# Altium project 12_PCB_Project_12.PrjPcb
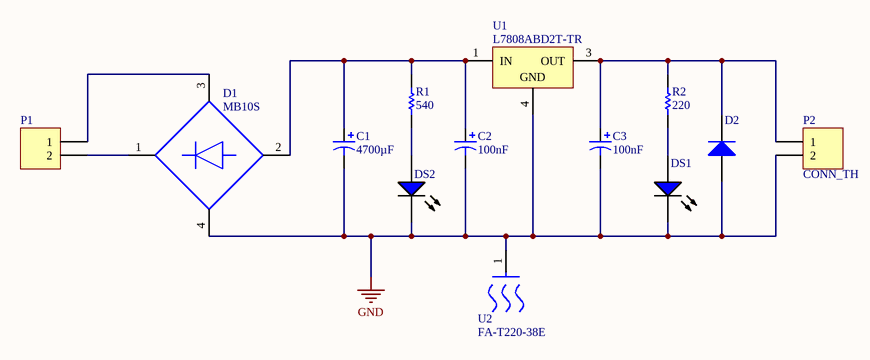
[diagram p0: Sheet1.SchDoc]
1 sheet, 13 parts. Net scope: global (net labels, ports and power ports of the same name join across sheets).
Board file: PCB2.PcbDoc

## Sheet Sheet1.SchDoc
size A; SheetNumber: 1; SheetTotal: 1; SPICEModelCachePIGDLGUO: <root> / <DocumentId>PIGDLGUO</DocumentId> / <CacheFrame Number="0"> / <Model Name="1n4007" Kind="MDL"> / <Text>*1N4007 MCE 8-16-95 / *1000V 1A Si GenPurpose Diode pkg:DIODE0.4 1,2 / .MODEL 1N4007 D(IS=2.55E-9 RS=0.042 N=1.75 TT=5.76E-6 CJO=1.85E-11 / + VJ=0.75 M=0.333 BV=1000 IBV=9.86E-5 )</Text> / </Model> / </CacheFrame> / </root>

### Parts
C1  value 4700µF  [RB7.6-15]  (hidden comment: Cap Pol1)
C2  value 100nF  [RB7.6-15]  (hidden comment: Cap Pol1)
C3  value 100nF  [RB7.6-15]  (hidden comment: Cap Pol1)
D1  MB10S  [FP-751EP-MFG]
D2  1N4007  [DO-41]  (value not drawn)
DS1  WP710A10QBC/D  [KING-WP710A10QBCD_V]  (value not drawn)
DS2  WP710A10QBC/D  [KING-WP710A10QBCD_V]  (value not drawn)
P1  Header 2  [HDR1X2]  (value not drawn)
P2  CONN_TH  [HDR1X2]
R1  value 540  [AXIAL-0.3]  (hidden comment: Res1)
R2  value 220  [AXIAL-0.3]  (hidden comment: Res1)
U1  L7808ABD2T-TR  [TO-263_L]
U2  FA-T220-38E  [FP-FA-T220-38E-MFG]

### Nets
GND: C1.2 C2.2 C3.2 D1.4(2_~) D2.1(A) DS1.2(K) DS2.2(K) P2.2 U1.4(GND) U2.1(MNT_1)
NetC1_1: C1.1 C2.1 D1.2(-) R1.2 U1.1(IN)
NetC3_1: C3.1 D2.2(K) P2.1 R2.2 U1.3(OUT)
NetD1_1: D1.1(+) P1.2
NetD1_3: D1.3(1_~) P1.1
NetDS1_1: DS1.1(A) R2.1
NetDS2_1: DS2.1(A) R1.1

### Library data of the parts
C1-C3 = Cap Pol1: Polarized Capacitor (Radial); Published: 8-Jun-2000; LatestRevisionDate: 17-Jul-2002; LatestRevisionNote: Re-released for DXP Platform.; PackageReference: RB7.6-15; Publisher: Altium Limited; PackageDescription: Polarized Capacitor (Radial); 2 Leads
D1 = CMP-07163-000045-1: BRIDGE RECT 1P 1KV 500MA 4SOIC; Capacitance: 470pF; Forward Current: 800mA; Element Configuration: Single; Number of Elements: 1; Max Forward Surge Current (Ifsm): 35A; Lead/Base Style: Formed Leads; Forward Voltage: 1V; Tolerance: 10%; Voltage Rating: 500V; Max Power Dissipation: 1.4W; Peak Reverse Current: 5uA; Case/Package: SOIC; Min Operating Temperature: -55°C; Package Quantity: 500; Height: 2.7mm; Mount: Surface Mount; Average Rectified Current: 500mA; Radiation Hardening: No; Width: 4.2mm; Peak Non-Repetitive Surge Current: 35A; REACH SVHC: No SVHC; Max Repetitive Reverse Voltage (Vrrm): 1kV; Weight: 0.228g; Length: 4.95mm; Height - Seated (Max): 0.354inch; Case Code (Imperial): 1206; Thickness: 0.039inch; Packaging: Tape and Reel; Lead Free: Lead Free; Case Code (Metric): 3216; Contact Plating: Tin; Reverse Voltage (DC): 1kV; Number of Pins: 4; Max Operating Temperature: 150°C; Lead Pitch: 0.197inch; Max Surge Current: 35A
D2 = Diode 1N4007: 1 Amp General Purpose Rectifier; Published: 8-Jun-2000; LatestRevisionDate: 17-Jul-2002; LatestRevisionNote: Re-released for DXP Platform.; DatasheetVersion: 1998; PackageVersion: Aug-1999; PackageReference: DO-41; Publisher: Altium Limited; PackageDescription: Diode, Axial; Body 5.2 x 2.7 mm (LxDia. max), Lead Dia. 0.86 mm (max); Code_JEDEC: DO-204-AL; ComponentLink1Description: Manufacturer Link; ComponentLink1URL: http://www.fairchildsemi.com/; ComponentLink2Description: Datasheet; ComponentLink2URL: http://www.fairchildsemi.com/ds/1N%2F1N4001.pdf
DS1 DS2 = CMP-2000-07416-1: Blue LED, 3.3 V, 20 mA, -40 to 85 degC, 2-Pin THD, RoHS, Bulk; Manufacturer: Kingbright; Forward Current: 20mA; LED Size: T-1; Viewing Angle: 20deg; Lens Color/Style: WaterClear; Wavelength/Color Temperature: 470nm; Forward Voltage: 3.3V; Luminous Intensity: 1600mcd; Lens Shape: Dome; Type: SolidStateLEDLamp; Minimum Operating Temperature: -40C; Package Description: 2-Pin Through Hole Device, Dia 3.2 mm; Packaging: Bulk; Maximum Operating Temperature: +85C; Factory Pack Quantity: 500; Mounting Technology: ThroughHole; Datasheet URL: https://datasheet.ciiva.com/2121/wp710a10qbc-d-2121617.pdf; Datasheet Version: Rev. 5B, 09/2014; Package Reference: WP710A10QBCD; Lens Dimensions: 3mmx4.6mm; Product Category: StandardLEDs-ThroughHole; Manufacturer URL: http://www.kingbright.com/; Mounting Style: ThroughHole; RoHS: Details; Illumination Color: Blue
P1 P2 = Header 2: Header, 2-Pin; LatestRevisionDate: 17-Jul-2002; LatestRevisionNote: Re-released for DXP Platform.; Publisher: Altium Limited
R1 R2 = Res1: Resistor; Published: 8-Jun-2000; LatestRevisionDate: 17-Jul-2002; LatestRevisionNote: Re-released for DXP Platform.; PackageReference: AXIAL-0.3; Publisher: Altium Limited; PackageDescription: Axial Device, Thru-Hole; 2 Leads; 0.3 in Pin Spacing
U1 = CMP-0244-00207-1: Positive Voltage Regulator, 3-Pin D2PAK, Tape and Reel; ComponentLink1Description: Manufacturer URL; PackageDescription: 3-Pin Transistor Outline Package 2.54 mm Pitch, 15.4 mm Lead Span (D2PAK); ComponentLink1URL: http://www.st.com; PackageVersion: 2011; DatasheetVersion: 16/11/2011; PackageReference: TO-263; ComponentLink2URL: http://www.st.com/internet/com/TECHNICAL_RESOURCES/TECHNICAL_LITERATURE/DATASHEET/CD00000444.pdf; ComponentLink2Description: Datasheet
U2 = CMP-33535-000020-1: HEATSINK TO-218,TO-220,TO-247; Natural Thermal Resistance: 3.8°C/W; Shape: Fins; Thermal Resistance @ Forced Air Flow (100 LFM): 1.5°C/W; Finish: Anodized; Width: 25mm; Length: 41.6mm; Material: Aluminium; Case/Package: TO-220; Height: 38.1mm; Packaging: Bulk; Height Off Base: 0.984inch; Series: F; Mount: Bolt; Weight: 27g; RoHS Compliant: Yes; Type: Passive; Package Cooled: TO-220; Color: Black; Package Quantity: 10